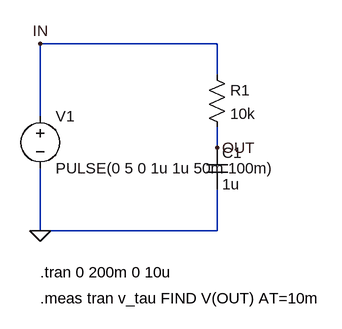
[diagram p0: schematic 02-rc.asc]
02-rc.asc, the LTspice schematic file:
Version 4
SHEET 1 880 680
WIRE 128 64 400 64
WIRE 128 64 128 176
WIRE 400 64 400 112
WIRE 400 192 400 224
WIRE 400 288 400 352
WIRE 400 352 128 352
WIRE 128 352 128 256
FLAG 128 352 0
FLAG 128 64 IN
FLAG 400 224 OUT
SYMBOL voltage 128 160 R0
SYMATTR InstName V1
SYMATTR Value PULSE(0 5 0 1u 1u 50m 100m)
SYMBOL res 384 96 R0
SYMATTR InstName R1
SYMATTR Value 10k
SYMBOL cap 384 224 R0
SYMATTR InstName C1
SYMATTR Value 1u
TEXT 128 416 Left 2 !.tran 0 200m 0 10u
TEXT 128 456 Left 2 !.meas tran v_tau FIND V(OUT) AT=10m

The netlist it stands for:
* 02-rc.asc
V1 IN 0 PULSE(0 5 0 1u 1u 50m 100m)
R1 IN OUT 10k
C1 OUT 0 1u
.tran 0 200m 0 10u
.meas tran v_tau FIND V(OUT) AT=10m
.backanno
.end